# Altium schematic sheet control.SchDoc
size A4; SheetNumber: 1; SheetTotal: 5
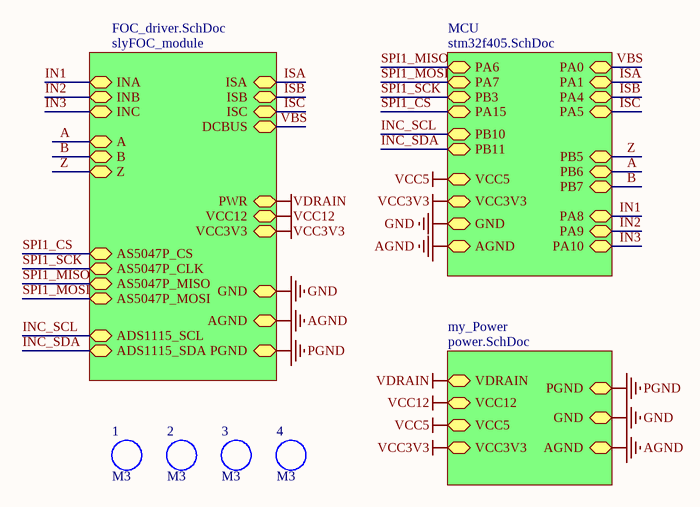
[diagram p0: control.SchDoc]

## Parts
1  M3  [M3x9+6_N]
2  M3  [M3x9+6_N]
3  M3  [M3x9+6_N]
4  M3  [M3x9+6_N]

## Sub-sheets
MCU = stm32f405.SchDoc: PA1 (bidir), PA4 (bidir), PA5 (bidir), PA8 (bidir), PA9 (bidir), PA10 (bidir), PA0 (bidir), VCC3V3 (bidir), GND (bidir), AGND (bidir), PB5 (bidir), PB6 (bidir), PB7 (bidir), VCC5 (bidir), PA6 (bidir), PA7 (bidir), PB3 (bidir), PA15 (bidir), PB10 (bidir), PB11 (bidir)
my_Power = power.SchDoc: VCC12 (bidir), VDRAIN (bidir), VCC5 (bidir), VCC3V3 (bidir), GND (bidir), PGND (bidir), AGND (bidir)
slyFOC_module = FOC_driver.SchDoc: INA (bidir), INB (bidir), INC (bidir), ISA (bidir), ISB (bidir), ISC (bidir), PGND (bidir), AGND (bidir), GND (bidir), PWR (bidir), VCC12 (bidir), VCC3V3 (bidir), DCBUS (bidir), A (bidir), B (bidir), Z (bidir), AS5047P_CS (bidir), AS5047P_CLK (bidir), AS5047P_MISO (bidir), AS5047P_MOSI (bidir), ADS1115_SCL (bidir), ADS1115_SDA (bidir)

## Nets
AGND: sheet my_Power/AGND, sheet MCU/AGND, sheet slyFOC_module/AGND
GND: sheet my_Power/GND, sheet MCU/GND, sheet slyFOC_module/GND
PGND: sheet my_Power/PGND, sheet slyFOC_module/PGND
VCC3V3: sheet my_Power/VCC3V3, sheet MCU/VCC3V3, sheet slyFOC_module/VCC3V3
VCC5: sheet my_Power/VCC5, sheet MCU/VCC5
VCC12: sheet my_Power/VCC12, sheet slyFOC_module/VCC12
VDRAIN: sheet my_Power/VDRAIN, sheet slyFOC_module/PWR
A: sheet MCU/PB6, sheet slyFOC_module/A
B: sheet MCU/PB7, sheet slyFOC_module/B
IN1: sheet MCU/PA8, sheet slyFOC_module/INA
IN2: sheet MCU/PA9, sheet slyFOC_module/INB
IN3: sheet MCU/PA10, sheet slyFOC_module/INC
INC_SCL: sheet MCU/PB10, sheet slyFOC_module/ADS1115_SCL
INC_SDA: sheet MCU/PB11, sheet slyFOC_module/ADS1115_SDA
ISA: sheet MCU/PA1, sheet slyFOC_module/ISA
ISB: sheet MCU/PA4, sheet slyFOC_module/ISB
ISC: sheet MCU/PA5, sheet slyFOC_module/ISC
SPI1_CS: sheet MCU/PA15, sheet slyFOC_module/AS5047P_CS
SPI1_MISO: sheet MCU/PA6, sheet slyFOC_module/AS5047P_MISO
SPI1_MOSI: sheet MCU/PA7, sheet slyFOC_module/AS5047P_MOSI
SPI1_SCK: sheet MCU/PB3, sheet slyFOC_module/AS5047P_CLK
VBS: sheet MCU/PA0, sheet slyFOC_module/DCBUS
Z: sheet MCU/PB5, sheet slyFOC_module/Z

## Library data of the parts
1-4 = M3: 铜柱孔; BOM名称: 铜柱孔